# Altium schematic sheet Notch_Filter.SchDoc
size A4; DocumentNumber: 3; SheetNumber: 4; SheetTotal: 4
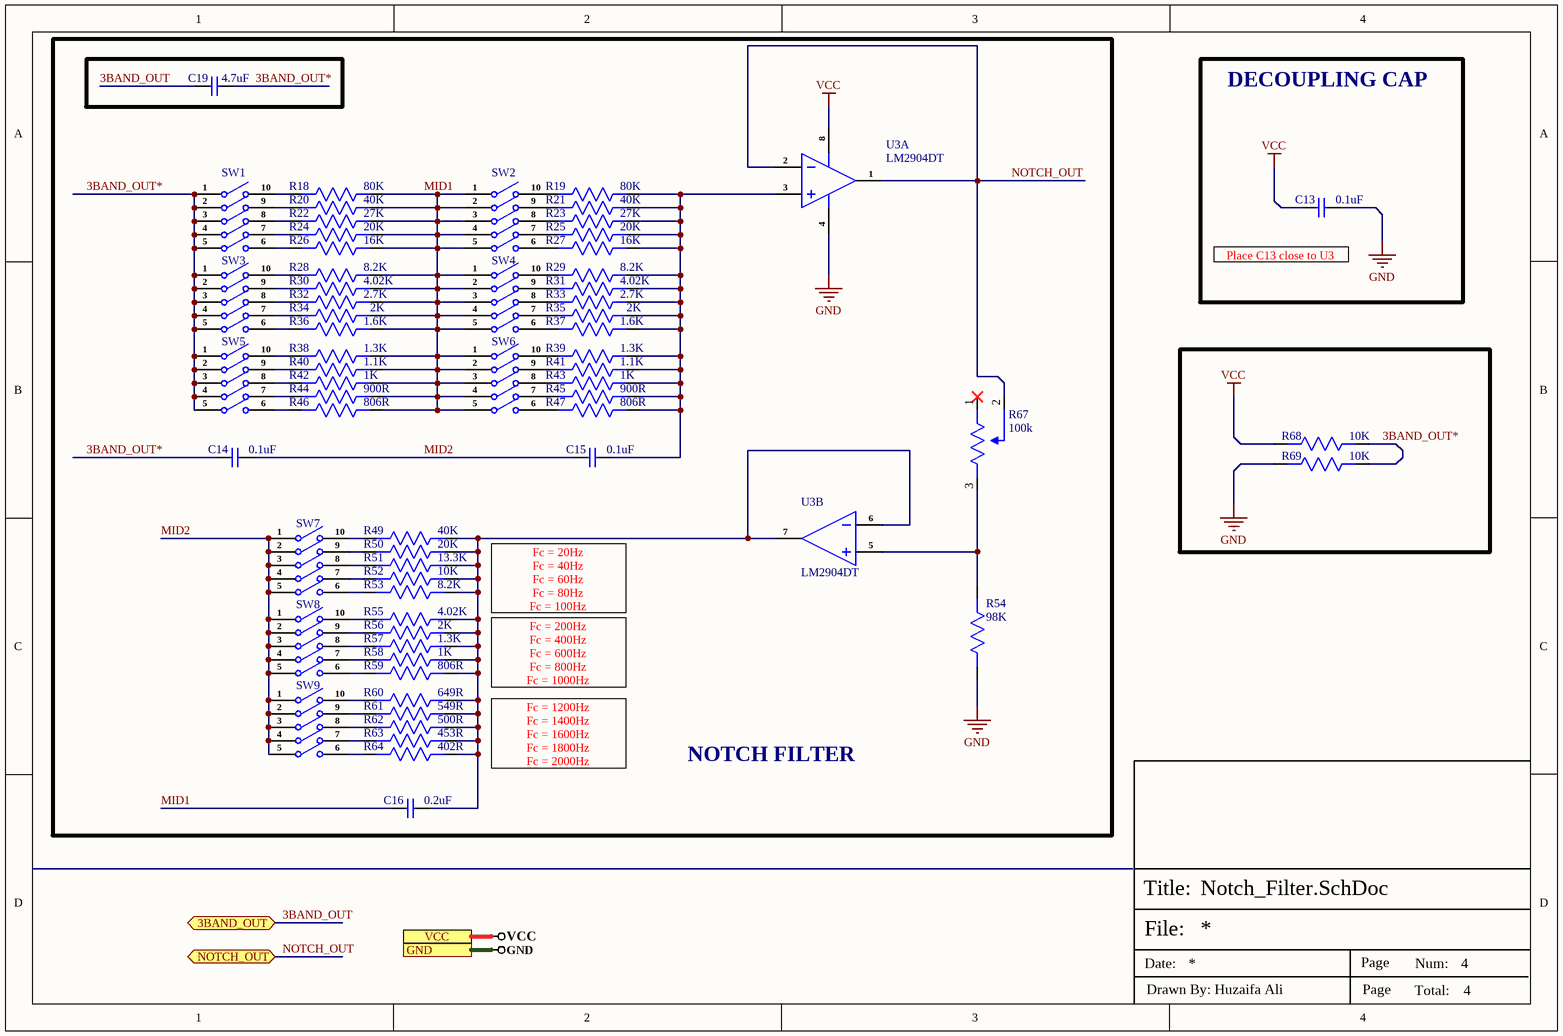
[diagram p0: Notch_Filter.SchDoc]

## Parts
C13  0.1uF  [CAP-0603]
C14  0.1uF  [Cap-1206]
C15  0.1uF  [Cap-1206]
C16  0.2uF  [Cap-0805]
C19  4.7uF  [Cap-1206]
R18  80K  [Res-0603]
R19  80K  [Res-0603]
R20  40K  [RES-0805]
R21  40K  [RES-0805]
R22  27K  [Res-0402]
R23  27K  [Res-0402]
R24  20K  [Res-0603]
R25  20K  [Res-0603]
R26  16K  [Res-0603]
R27  16K  [Res-0603]
R28  8.2K  [Res-0603]
R29  8.2K  [Res-0603]
R30  4.02K  [Res-0402]
R31  4.02K  [Res-0402]
R32  2.7K  [Res-0603]
R33  2.7K  [Res-0603]
R34  2K  [Res-0603]
R35  2K  [Res-0603]
R36  1.6K  [Res-0402]
R37  1.6K  [Res-0402]
R38  1.3K  [Res-0603]
R39  1.3K  [Res-0603]
R40  1.1K  [Res-0603]
R41  1.1K  [Res-0603]
R42  1K  [Res-0603]
R43  1K  [Res-0603]
R44  900R  [RES-0805]
R45  900R  [RES-0805]
R46  806R  [Res-0402]
R47  806R  [Res-0402]
R49  40K  [RES-0805]
R50  20K  [Res-0603]
R51  13.3K  [Res-0603]
R52  10K  [Res-0603]
R53  8.2K  [Res-0603]
R54  98K  [RES-0805]
R55  4.02K  [Res-0402]
R56  2K  [Res-0603]
R57  1.3K  [Res-0603]
R58  1K  [Res-0603]
R59  806R  [Res-0402]
R60  649R  [RES-0805]
R61  549R  [Res-0402]
R62  500R  [RES-0805]
R63  453R  [Res-0402]
R64  402R  [Res-0603]
R67  100k  [TC33X-2-104E_]
R68  10K  [Res-0603]
R69  10K  [Res-0603]
SW1  DSIC05LS-P  [DSIC05LS-P_]  (value not drawn)
SW2  DSIC05LS-P  [DSIC05LS-P_]  (value not drawn)
SW3  DSIC05LS-P  [DSIC05LS-P_]  (value not drawn)
SW4  DSIC05LS-P  [DSIC05LS-P_]  (value not drawn)
SW5  DSIC05LS-P  [DSIC05LS-P_]  (value not drawn)
SW6  DSIC05LS-P  [DSIC05LS-P_]  (value not drawn)
SW7  DSIC05LS-P  [DSIC05LS-P_]  (value not drawn)
SW8  DSIC05LS-P  [DSIC05LS-P_]  (value not drawn)
SW9  DSIC05LS-P  [DSIC05LS-P_]  (value not drawn)
U3  LM2904DT  [SOIC-8]  (parts A,B of 2)

## Blocks framed on the sheet
NOTCH FILTER: C14-C16 C19 R18-R47 R49-R64 R67 SW1-SW9 U3
DECOUPLING CAP: C13

## Ports
3BAND_OUT (bidir), GND, NOTCH_OUT (bidir), VCC

## Nets
GND: C13.2 R54.2 R69.2 U3.4(VCC-) ; port GND
VCC: C13.1 R68.2 U3.8(VCC+) ; port VCC
3BAND_OUT: C19.1 ; port 3BAND_OUT
3BAND_OUT*: C14.1 C19.2 R68.1 R69.1 SW1.1 SW1.2 SW1.3 SW1.4 SW1.5 SW3.1 SW3.2 SW3.3 SW3.4 SW3.5 SW5.1 SW5.2 SW5.3 SW5.4 SW5.5
MID1: C16.1 R18.1 R20.1 R22.1 R24.1 R26.1 R28.1 R30.1 R32.1 R34.1 R36.1 R38.1 R40.1 R42.1 R44.1 R46.1 SW2.1 SW2.2 SW2.3 SW2.4 SW2.5 SW4.1 SW4.2 SW4.3 SW4.4 SW4.5 SW6.1 SW6.2 SW6.3 SW6.4 SW6.5
MID2: C14.2 C15.1 SW7.1 SW7.2 SW7.3 SW7.4 SW7.5 SW8.1 SW8.2 SW8.3 SW8.4 SW8.5 SW9.1 SW9.2 SW9.3 SW9.4 SW9.5
NOTCH_OUT: R67.2(Wiper) U3.1(1OUT) U3.2(IN-) ; port NOTCH_OUT
NetC15_2: C15.2 R19.1 R21.1 R23.1 R25.1 R27.1 R29.1 R31.1 R33.1 R35.1 R37.1 R39.1 R41.1 R43.1 R45.1 R47.1 U3.3(IN+)
NetC16_2: C16.2 R49.1 R50.1 R51.1 R52.1 R53.1 R55.1 R56.1 R57.1 R58.1 R59.1 R60.1 R61.1 R62.1 R63.1 R64.1 U3.6(2IN-) U3.7(2OUT)
NetR18_2: R18.2 SW1.10
NetR19_2: R19.2 SW2.10
NetR20_2: R20.2 SW1.9
NetR21_2: R21.2 SW2.9
NetR22_2: R22.2 SW1.8
NetR23_2: R23.2 SW2.8
NetR24_2: R24.2 SW1.7
NetR25_2: R25.2 SW2.7
NetR26_2: R26.2 SW1.6
NetR27_2: R27.2 SW2.6
NetR28_2: R28.2 SW3.10
NetR29_2: R29.2 SW4.10
NetR30_2: R30.2 SW3.9
NetR31_2: R31.2 SW4.9
NetR32_2: R32.2 SW3.8
NetR33_2: R33.2 SW4.8
NetR34_2: R34.2 SW3.7
NetR35_2: R35.2 SW4.7
NetR36_2: R36.2 SW3.6
NetR37_2: R37.2 SW4.6
NetR38_2: R38.2 SW5.10
NetR39_2: R39.2 SW6.10
NetR40_2: R40.2 SW5.9
NetR41_2: R41.2 SW6.9
NetR42_2: R42.2 SW5.8
NetR43_2: R43.2 SW6.8
NetR44_2: R44.2 SW5.7
NetR45_2: R45.2 SW6.7
NetR46_2: R46.2 SW5.6
NetR47_2: R47.2 SW6.6
NetR49_2: R49.2 SW7.10
NetR50_2: R50.2 SW7.9
NetR51_2: R51.2 SW7.8
NetR52_2: R52.2 SW7.7
NetR53_2: R53.2 SW7.6
NetR54_1: R54.1 R67.3(CW) U3.5(2IN+)
NetR55_2: R55.2 SW8.10
NetR56_2: R56.2 SW8.9
NetR57_2: R57.2 SW8.8
NetR58_2: R58.2 SW8.7
NetR59_2: R59.2 SW8.6
NetR60_2: R60.2 SW9.10
NetR61_2: R61.2 SW9.9
NetR62_2: R62.2 SW9.8
NetR63_2: R63.2 SW9.7
NetR64_2: R64.2 SW9.6

Not connected (* = marked no-connect by the designer): R67 1(CCW)*

## Notes on the sheet
- (near C13) Place C13 close to U3
- Fc = 20Hz
  Fc = 40Hz
  Fc = 60Hz
  Fc = 80Hz
  Fc = 100Hz
- Fc = 200Hz
  Fc = 400Hz
  Fc = 600Hz
  Fc = 800Hz
  Fc = 1000Hz
- Fc = 1200Hz
  Fc = 1400Hz
  Fc = 1600Hz
  Fc = 1800Hz
  Fc = 2000Hz
- File:
- Title:
- Date:
- Page
- Num:
- Total:
- Drawn By: Huzaifa Ali

## Library data of the parts
C13 = CL10B104KB8NNNL: CAP CER 0.1UF 50V X7R 0603; Manufacturer: Samsung; Capacitance: 100nF; Tolerance: 10%; Supplier 1: Digi-Key; Manufacturer Part Number: CL10B104KB8NNNL; Stock 1: 3731229; Pricing 1: 1=0.1, 10=0.03, 50=0.0164, 100=0.0134, 500=0.00958, 1000=0.00753, 2500=0.00684, 5000=0.0063 (USD); Mount: Surface Mount; Case/Package: 0603; Min Operating Temperature: -55°C; Max Operating Temperature: 125°C; Dielectric: X7R; Packaging: Tape and Reel; Package Quantity: 15000; Voltage Rating: 50V; Voltage Rating (DC): 50V; Series: CL; Construction: Flat; Length: 1.6mm; Width: 0.031inch; Height: 0.8mm; Thickness: 0.035inch; Depth: 0.8mm; Radiation Hardening: No; RoHS Compliant: Yes; ComponentLink1URL: https://www.verical.com/server-webapp/html/getDatasheet?partID=357523&src-supplier=Verical; ComponentLink1Description: https://www.verical.com/server-webapp/html/getDatasheet?partID=357523&src-supplier=Verical; ComponentLink2URL: https://media.digikey.com/pdf/Data%20Sheets/Samsung%20PDFs/CL_Series_MLCC_ds.pdf?src-supplier=Digi-Key; ComponentLink2Description: https://media.digikey.com/pdf/Data%20Sheets/Samsung%20PDFs/CL_Series_MLCC_ds.pdf?src-supplier=Digi-Key; Supplier Part Number 1: 1276-CL10B104KB8NNNLCT-ND; LCSC Part Number: C913912
C14 C15 = GRM31C5C1H104FA01L: 50V 100nF C0G ±1% 1206 Multilayer Ceramic Capacitors MLCC - SMD/SMT ROHS; Manufacturer: Murata Electronics; LCSC Part Number: C2981728; Item Type: Capacitor; Manufacturer Part Number: GRM31C5C1H104FA01L; ComponentLink1Description: LCSC; ComponentLink1URL: https://www.lcsc.com/product-detail/Multilayer-Ceramic-Capacitors-MLCC-SMD-SMT_Murata-Electronics-GRM31C5C1H104FA01L_C2981728.html
C16 = NL0805B204K500CPBN: 50V 200nF ±10% 0805 Multilayer Ceramic Capacitors MLCC - SMD/SMT ROHS; Manufacturer: HUI JU; Manufacturer Part Number: NL0805B204K500CPBN; LCSC Part Number: C918135; Item Type: Capacitor; ComponentLink1Description: LCSC; ComponentLink1URL: https://www.lcsc.com/product-detail/Multilayer-Ceramic-Capacitors-MLCC-SMD-SMT_HUI-JU-NL0805B204K500CPBN_C918135.html; Value: 0.2uF
C19 = C3216X7R1H475K160AC: CAP CER 4.7UF 50V X7R 1206; Manufacturer: TDK; Dielectric Material: Ceramic; Tolerance: 10%; Supplier 1: Digi-Key; Manufacturer Part Number: C3216X7R1H475K160AC; Stock 1: 93848; Pricing 1: 1=0.76, 10=0.535, 50=0.4042, 100=0.3521, 500=0.26082, 1000=0.2217 (USD); Mount: Surface Mount; Case/Package: 1206; Case Code (Metric): 3216; Case Code (Imperial): 1206; Weight: 0.000571oz; Min Operating Temperature: -55°C; Max Operating Temperature: 125°C; Capacitance: 4.7uF; Voltage Rating: 50V; Packaging: Tape and Reel; Voltage Rating (DC): 50V; Termination: SMD/SMT; Series: C; Package Quantity: 1; Dielectric: X7R; Resistor Type: Ceramic; Length: 3.2mm; Width: 0.063inch; Depth: 1.6mm; Thickness: 1.6mm; REACH SVHC: No SVHC; Lead Free: Lead Free; RoHS Compliant: Yes; ComponentLink1URL: https://product.tdk.com/info/en/catalog/datasheets/mlcc_commercial_general_en.pdf?src-supplier=Digi-Key; ComponentLink1Description: https://product.tdk.com/info/en/catalog/datasheets/mlcc_commercial_general_en.pdf?src-supplier=Digi-Key; ComponentLink2URL: http://www.mouser.com/ds/2/400/lcc_commercial_general_en-560200.pdf?src-supplier=Mouser; ComponentLink2Description: http://www.mouser.com/ds/2/400/lcc_commercial_general_en-560200.pdf?src-supplier=Mouser; ComponentLink3URL: http://product.tdk.com/capacitor/mlcc/en/documents/mlcc_commercial_general_en.pdf?src-supplier=Future+Electronics; ComponentLink3Description: http://product.tdk.com/capacitor/mlcc/en/documents/mlcc_commercial_general_en.pdf?src-supplier=Future+Electronics; Supplier Part Number 1: 445-8032-1-ND; LCSC Part Number: C2167787
R18 R19 = ARG03FTC8002N: ±1% 80kΩ 0603 Chip Resistor - Surface Mount ROHS; Manufacturer: Viking Tech; Manufacturer Part Number: ARG03FTC8002N; LCSC Part Number: C3014409; Item Type: Resistor; Value: 80K; ComponentLink1Description: LCSC; ComponentLink1URL: https://www.lcsc.com/product-detail/Chip-Resistor-Surface-Mount_Viking-Tech-ARG03FTC8002N_C3014409.html
R20 R21 R49 = AR05BTC4002: ±0.1% 40kΩ 0805 Chip Resistor - Surface Mount ROHS; Manufacturer: Viking Tech; Manufacturer Part Number: AR05BTC4002; LCSC Part Number: C5266069; Item Type: Resistor; ComponentLink1Description: LCSC; ComponentLink1URL: https://www.lcsc.com/product-detail/Chip-Resistor-Surface-Mount_Viking-Tech-AR05BTC4002_C5266069.html; Value: 40K
R22 R23 = ARG02BTC2702: ±25ppm/℃ ±0.1% 27kΩ 0402 Chip Resistor - Surface Mount ROHS; Manufacturer: Viking Tech; Manufacturer Part Number: ARG02BTC2702; LCSC Part Number: C5266105; Item Type: Resistor; ComponentLink1Description: LCSC; ComponentLink1URL: https://www.lcsc.com/product-detail/Chip-Resistor-Surface-Mount_Viking-Tech-ARG02BTC2702_C5266105.html; Value: 27K
R24 R25 R50 = AR03BTCX2002: 100mW ±25ppm/℃ ±0.1% 20kΩ 0603 Chip Resistor - Surface Mount ROHS; Manufacturer: Viking Tech; Manufacturer Part Number: AR03BTCX2002; LCSC Part Number: C319766; Item Type: Resistor; ComponentLink1Description: LCSC; ComponentLink1URL: https://www.lcsc.com/product-detail/Chip-Resistor-Surface-Mount_Viking-Tech-AR03BTCX2002_C319766.html; Value: 20K
R26 R27 = RC0603DR-0716KL: RES 16K OHM 0.5% 1/10W 0603; Manufacturer: Yageo; Resistance: 16kR; Max Power Dissipation: 100mW; Temperature Coefficient: 100ppm/°C; Item Type: Resistor; Supplier 1: Avnet; Manufacturer Part Number: RC0603DR-0716KL; RoHS: Yes; Category: Chip SMD Resistors; Pricing 1: 5000=0.00430, 10000=0.00424, 20000=0.00411 (USD); Case/Package: 0603; Min Operating Temperature: -55°C; Max Operating Temperature: 155°C; Tolerance: 0.5%; Packaging: Tape and Reel; Resistor Type: Thick Film; Number of Terminations: 2; Features: Moisture Resistant; Length: 0.063inch; Width: 0.031inch; Height: 0.022inch; RoHS Compliant: Yes; ComponentLink1URL: http://www.yageo.com.tw/exep/pages/download/literatures/PYu-R_INT-thick_7.pdf?src-supplier=Digi-Key; ComponentLink1Description: http://www.yageo.com.tw/exep/pages/download/literatures/PYu-R_INT-thick_7.pdf?src-supplier=Digi-Key; Supplier Part Number 1: RC0603DR-0716KL; LCSC Part Number: C327136
R28 R29 R53 = RT0603BRD078K2L: RES SMD 8.2K OHM 0.1% 1/10W 0603; Manufacturer: Yageo; Power: 100mW; Rated Temperature: 70°C; Value: 8.2kR; Temperature Coefficient: 25ppm/°C; Working Voltage: 75V; Package Height: 0.45mm; Package Length: 1.6mm; Package Width: 0.8mm; Item Type: Resistor; Supplier 1: Rs; Manufacturer Part Number: RT0603BRD078K2L; RoHS: Yes; Category: Chip SMD Resistors; Stock 1: 4900; Pricing 1: 100=0.21900, 250=0.20400, 500=0.19000, 1000=0.17400 (GBP); Mounting Technology: Surface Mount; Pins: 2; Case/Package: 0603; Min Operating Temperature: -55°C; Max Operating Temperature: 155°C; Tolerance: 0.1%; Resistor Type: FIXED RESISTOR; Construction: Chip; Package Style: SMTMeter; Packaging: Tape and Reel; Technology: THIN FILM; Termination: Wraparound; Reach SVHC Compliant: Yes; RoHS Compliant: Yes; ComponentLink1URL: https://datasheet.ciiva.com:443/pdfs/VipMasterIC/IC/YAGO/YAGO-S-A0008510989/YAGO-S-A0008510989-1.pdf?src-supplier=IHS+Markit; ComponentLink1Description: https://datasheet.ciiva.com:443/pdfs/VipMasterIC/IC/YAGO/YAGO-S-A0008510989/YAGO-S-A0008510989-1.pdf?src-supplier=IHS+Markit; ComponentLink2URL: https://datasheet.ciiva.com/12809/pyu-rt-1-to-0-05-rohs-l-4-12809820.pdf?src-supplier=Mouser; ComponentLink2Description: https://datasheet.ciiva.com/12809/pyu-rt-1-to-0-05-rohs-l-4-12809820.pdf?src-supplier=Mouser; Supplier Part Number 1: 1991627P; LCSC Part Number: C861589
R30 R31 R55 = RC0402FR-074K02L: RES 4.02K OHM 1% 1/16W 0402; Manufacturer: Yageo; Resistance: 4.02kR; Temperature Coefficient: 100ppm/°C; Power Rating: 62.5mW; Voltage Rating: 50V; Max Power Dissipation: 63mW; Supplier 1: Mouser; Manufacturer Part Number: RC0402FR-074K02L; RoHS: Yes; Category: Chip SMD Resistors; Stock 1: 302754; Pricing 1: 1=0.10000, 10=0.01200, 50=0.01200, 100=0.00500, 1000=0.00300, 2500=0.00200, 10000=0.00100 (USD); Case/Package: 0402; Contact Plating: Tin,Matte; Case Code (Metric): 1005; Case Code (Imperial): 0402; Min Operating Temperature: -55°C; Max Operating Temperature: 155°C; Tolerance: 1%; Resistor Type: Thick Film; Packaging: Tape and Reel; Package Quantity: 1; Number of Terminations: 2; Termination: SMD/SMT; Working Voltage: 50V; Features: Moisture Resistant; Series: RC; Construction: Rectangular; Technology: THICK FILM; Length: 1mm; Width: 0.02inch; Height: 0.016inch; Depth: 0.5mm; Military Standard: Not; Lead Free: Lead Free; RoHS Compliant: Yes; ComponentLink1URL: https://datasheet.ciiva.com/2553/pyu-r-int-thick-7-2553258.pdf?src-supplier=Digi-Key; ComponentLink1Description: https://datasheet.ciiva.com/2553/pyu-r-int-thick-7-2553258.pdf?src-supplier=Digi-Key; ComponentLink2URL: https://datasheet.ciiva.com/2553/pyu-r-int-thick-7-2553259.pdf?src-supplier=Digi-Key; ComponentLink2Description: https://datasheet.ciiva.com/2553/pyu-r-int-thick-7-2553259.pdf?src-supplier=Digi-Key; ComponentLink3URL: https://datasheet.ciiva.com/2553/pyu-r-int-thick-7-2553257.pdf?src-supplier=Digi-Key; ComponentLink3Description: https://datasheet.ciiva.com/2553/pyu-r-int-thick-7-2553257.pdf?src-supplier=Digi-Key; ComponentLink4URL: https://datasheet.ciiva.com/12668/pyu-rc0402-51-rohs-l-6-r-12668204.pdf?src-supplier=Mouser; ComponentLink4Description: https://datasheet.ciiva.com/12668/pyu-rc0402-51-rohs-l-6-r-12668204.pdf?src-supplier=Mouser; ComponentLink5URL: https://datasheet.ciiva.com/16741/pyu-rc0402-51-rohs-l-6-r-16741438.pdf?src-supplier=Future+Electronics; ComponentLink5Description: https://datasheet.ciiva.com/16741/pyu-rc0402-51-rohs-l-6-r-16741438.pdf?src-supplier=Future+Electronics; Supplier Part Number 1: 603-RC0402FR-074K02L; LCSC Part Number: C137968
R32 R33 = RC0603FR-072K7L: RES 2.7K OHM 1% 1/10W 0603; Manufacturer: Yageo; Resistance: 2.7kR; Voltage Rating (DC): 50V; Temperature Coefficient: 100ppm/°C; Power Rating: 100mW; Item Type: Resistor; Supplier 1: Avnet; Manufacturer Part Number: RC0603FR-072K7L; RoHS: Yes; Category: Chip SMD Resistors; Stock 1: 5000; Pricing 1: 5000=0.00133, 10000=0.00131, 20000=0.00127 (USD); Case/Package: 0603; Number of Pins: 2; Case Code (Imperial): 0603; Case Code (Metric): 1608; Size Code: 0603; Min Operating Temperature: -55°C; Max Operating Temperature: 155°C; Tolerance: 1%; Packaging: Tape and Reel; Resistor Type: Thick Film; Voltage Rating: 50V; Package Quantity: 1; Termination: SMD/SMT; Number of Terminations: 2; Max Power Dissipation: 100mW; Features: Moisture Resistant; Series: RC; Resistance Tolerance: 1%; Construction: Rectangular; Length: 0.063inch; Width: 0.031inch; Height: 0.022inch; Depth: 0.8mm; Reach SVHC Compliant: Yes; Lead Free: Lead Free; Military Standard: Not; RoHS Compliant: Yes; Supplier Part Number 1: RC0603FR-072K7L; LCSC Part Number: C114612
R34 R35 R56 = AR03BTCX2001: 100mW ±25ppm/℃ ±0.1% 2kΩ 0603 Chip Resistor - Surface Mount ROHS; Manufacturer: Viking Tech; Manufacturer Part Number: AR03BTCX2001; LCSC Part Number: C318130; Item Type: Resistor; ComponentLink1Description: LCSC; ComponentLink1URL: https://www.lcsc.com/product-detail/Chip-Resistor-Surface-Mount_Viking-Tech-AR03BTCX2001_C318130.html; Value: 2K
R36 R37 = RT0402BRD071K6L: RES SMD 1.6K OHM 0.1% 1/16W 0402; Manufacturer: Yageo; Resistance: 1.6kR; Power Rating: 62.5mW; Voltage Rating: 50V; Temperature Coefficient: 25ppm/°C; Max Power Dissipation: 63mW; Item Type: Resistor; Supplier 1: Digi-Key; Manufacturer Part Number: RT0402BRD071K6L; RoHS: Yes; Category: Chip SMD Resistors; Stock 1: 20555; Pricing 1: 1=0.40000, 10=0.33600, 100=0.13130, 500=0.07938, 1000=0.05496, 2500=0.05038, 5000=0.04580 (USD); Case/Package: 0402; Case Code (Imperial): 0402; Case Code (Metric): 1005; Weight: 2.3E-05oz; Min Operating Temperature: -55°C; Max Operating Temperature: 125°C; Packaging: Tape and Reel; Tolerance: 0.1%; Package Quantity: 10000; Resistor Type: Thin Film; Termination: SMD/SMT; Number of Terminations: 2; Voltage Rating (DC): 50V; Series: RT; Length: 0.039inch; Width: 0.5mm; Height: 0.014inch; Lead Free: Lead Free; RoHS Compliant: Yes; ComponentLink1URL: https://datasheet.ciiva.com/2582/pyu-rt-1-to-0-05-rohs-l-5-2582211.pdf?src-supplier=Digi-Key; ComponentLink1Description: https://datasheet.ciiva.com/2582/pyu-rt-1-to-0-05-rohs-l-5-2582211.pdf?src-supplier=Digi-Key; LCSC Part Number: C852616; Supplier Part Number 1: YAG4199CT-ND
R38 R39 R57 = AR03BTCX1301: 100mW ±25ppm/℃ ±0.1% 1.3kΩ 0603 Chip Resistor - Surface Mount ROHS; Manufacturer: Viking Tech; Manufacturer Part Number: AR03BTCX1301; LCSC Part Number: C2984321; Item Type: Resistor; ComponentLink1Description: LCSC; ComponentLink1URL: https://www.lcsc.com/product-detail/Chip-Resistor-Surface-Mount_Viking-Tech-AR03BTCX1301_C2984321.html; Value: 1.3K
R40 R41 = RT0603BRD071K1L: RES SMD 1.1K OHM 0.1% 1/10W 0603; Manufacturer: Yageo; Resistance: 1.1kR; Temperature Coefficient: 25ppm/°C; Power Rating: 100mW; Voltage Rating: 75V; Voltage Rating (DC): 50V; Item Type: Resistor; Supplier 1: Rs; Manufacturer Part Number: RT0603BRD071K1L; RoHS: Yes; Category: Chip SMD Resistors; Stock 1: 7030; Pricing 1: 10=0.23500, 100=0.21900, 250=0.20400, 500=0.19000, 1000=0.17400 (GBP); Case/Package: 0603; Contact Plating: Tin,Matte; Case Code (Metric): 1608; Case Code (Imperial): 0603; Min Operating Temperature: -55°C; Max Operating Temperature: 125°C; Tolerance: 0.1%; Resistor Type: Thin Film; Package Quantity: 5000; Packaging: Tape and Reel; Number of Terminations: 2; Termination: SMD/SMT; Max Power Dissipation: 100mW; Features: Moisture Resistant; Series: RT; Length: 0.063inch; Width: 0.031inch; Height: 0.022inch; Radiation Hardening: No; Lead Free: Lead Free; RoHS Compliant: Yes; ComponentLink1URL: https://datasheet.ciiva.com/12725/pyu-rt-1-to-0-05-rohs-l-4-12725819.pdf?src-supplier=Mouser; ComponentLink1Description: https://datasheet.ciiva.com/12725/pyu-rt-1-to-0-05-rohs-l-4-12725819.pdf?src-supplier=Mouser; ComponentLink2URL: https://datasheet.ciiva.com/2585/pyu-rt-1-to-0-05-rohs-l-4-2585740.pdf?src-supplier=Digi-Key; ComponentLink2Description: https://datasheet.ciiva.com/2585/pyu-rt-1-to-0-05-rohs-l-4-2585740.pdf?src-supplier=Digi-Key; ComponentLink3URL: https://datasheet.ciiva.com/8895/pyu-rt-1-to-0-05-rohs-l-4-8895949.pdf?src-supplier=Avnet; ComponentLink3Description: https://datasheet.ciiva.com/8895/pyu-rt-1-to-0-05-rohs-l-4-8895949.pdf?src-supplier=Avnet; LCSC Part Number: C705736; Supplier Part Number 1: 1991436
R42 R43 R58 = RT0603BRD071KL: RES SMD 1K OHM 0.1% 1/10W 0603; Manufacturer: Yageo; Resistance: 1kR; Power Rating: 100mW; Voltage Rating: 75V; Temperature Coefficient: 25ppm/°C; Voltage Rating (DC): 50V; Item Type: Resistor; Supplier 1: Arrow Electronics; Manufacturer Part Number: RT0603BRD071KL; RoHS: Yes; Category: Chip SMD Resistors; Stock 1: 130000; Pricing 1: 5000=0.03900, 10000=0.03450, 25000=0.03070, 50000=0.02040 (USD); Mount: Surface Mount; Case/Package: 0603; Case Code (Metric): 1608; Case Code (Imperial): 0603; Contact Plating: Tin,Lead; Size Code: 0603; Min Operating Temperature: -55°C; Max Operating Temperature: 125°C; Package Quantity: 5000; Packaging: Tape and Reel; Resistor Type: Thin Film; Number of Terminations: 2; Termination: SMD/SMT; Max Power Dissipation: 100mW; Features: Moisture Resistant; Series: RT; Technology: THIN FILM; Construction: Rectangular; Length: 1.6mm; Width: 0.031inch; Height: 0.022inch; Depth: 0.8mm; Military Standard: Not; Lead Free: Lead Free; RoHS Compliant: Yes; ComponentLink1URL: https://datasheet.ciiva.com/11819/0900766b8079c86e-11819652.pdf?src-supplier=RSComponents; ComponentLink1Description: https://datasheet.ciiva.com/11819/0900766b8079c86e-11819652.pdf?src-supplier=RSComponents; ComponentLink2URL: https://datasheet.ciiva.com/5624/pyu-rt-1-to-0-05-rohs-l-4-5624759.pdf?src-supplier=Mouser; ComponentLink2Description: https://datasheet.ciiva.com/5624/pyu-rt-1-to-0-05-rohs-l-4-5624759.pdf?src-supplier=Mouser; ComponentLink3URL: https://datasheet.ciiva.com/29718/pyu-rt-1-to-0-05-rohs-l-4-29718010.pdf?src-supplier=Digi-Key; ComponentLink3Description: https://datasheet.ciiva.com/29718/pyu-rt-1-to-0-05-rohs-l-4-29718010.pdf?src-supplier=Digi-Key; ComponentLink4URL: https://datasheet.ciiva.com/29718/pyu-rt-1-to-0-05-rohs-l-4-29718011.pdf?src-supplier=Digi-Key; ComponentLink4Description: https://datasheet.ciiva.com/29718/pyu-rt-1-to-0-05-rohs-l-4-29718011.pdf?src-supplier=Digi-Key; Supplier Part Number 1: RT0603BRD071KL; LCSC Part Number: C110776
R44 R45 = ARG05BTC9000N: 125mW Thin Film Resistor 150V ±25ppm/℃ ±0.1% -55℃~+155℃ 900Ω 0805 Chip Resistor - Surface Mount ROHS; Manufacturer: Viking Tech; Manufacturer Part Number: ARG05BTC9000N; LCSC Part Number: C2828704; Item Type: Resistor; ComponentLink1Description: LCSC; ComponentLink1URL: https://www.lcsc.com/product-detail/Chip-Resistor-Surface-Mount_Viking-Tech-ARG05BTC9000N_C2828704.html; Value: 900R
R46 R47 R59 = RT0402BRD07806RL: RES SMD 806 OHM 0.1% 1/16W 0402; Manufacturer: Yageo; Voltage Rating: 50V; Power Rating: 62.5mW; Temperature Coefficient: 25ppm/°C; Max Power Dissipation: 63mW; Item Type: Resistor; Supplier 1: Arrow Electronics; Manufacturer Part Number: RT0402BRD07806RL; RoHS: Yes; Category: Chip SMD Resistors; Stock 1: 104; Pricing 1: 1=0.32050, 10=0.28580, 25=0.25690, 100=0.10950 (USD); Case/Package: 0402; Case Code (Metric): 1005; Case Code (Imperial): 0402; Min Operating Temperature: -55°C; Max Operating Temperature: 155°C; Resistance: 806R; Tolerance: 0.1%; Packaging: Tape and Reel; Package Quantity: 10000; Resistor Type: Thin Film; Termination: SMD/SMT; Number of Terminations: 2; Voltage Rating (DC): 50V; Features: Moisture Resistant; Series: RT; Length: 0.039inch; Width: 0.02inch; Height: 0.014inch; Lead Free: Lead Free; RoHS Compliant: Yes; ComponentLink1URL: https://datasheet.ciiva.com/2582/pyu-rt-1-to-0-05-rohs-l-4-2582500.pdf?src-supplier=Digi-Key; ComponentLink1Description: https://datasheet.ciiva.com/2582/pyu-rt-1-to-0-05-rohs-l-4-2582500.pdf?src-supplier=Digi-Key; ComponentLink2URL: https://datasheet.ciiva.com/46635/pyu-rt-1-to-0-05-rohs-l-5-46635068.pdf?src-supplier=Digi-Key; ComponentLink2Description: https://datasheet.ciiva.com/46635/pyu-rt-1-to-0-05-rohs-l-5-46635068.pdf?src-supplier=Digi-Key; LCSC Part Number: C852922; Supplier Part Number 1: RT0402BRD07806RL
R51 = RT0603BRD0713K3L: RES SMD 13.3KOHM 0.1% 1/10W 0603; Manufacturer: Yageo; Resistance: 13.3kR; Power Rating: 100mW; Voltage Rating: 75V; Temperature Coefficient: 25ppm/°C; Voltage Rating (DC): 50V; Item Type: Resistor; Supplier 1: Arrow Electronics; Manufacturer Part Number: RT0603BRD0713K3L; RoHS: Yes; Category: Chip SMD Resistors; Stock 1: 4750; Pricing 1: 1=0.29220, 10=0.24060, 25=0.23820, 100=0.10400, 250=0.10250, 500=0.10060, 1000=0.06040, 3000=0.04000 (USD); Case/Package: 0603; Case Code (Metric): 1608; Case Code (Imperial): 0603; Contact Plating: Tin,Matte; Min Operating Temperature: -55°C; Max Operating Temperature: 125°C; Tolerance: 0.1%; Packaging: Tape and Reel; Package Quantity: 5000; Resistor Type: Thin Film; Termination: SMD/SMT; Number of Terminations: 2; Max Power Dissipation: 100mW; Features: Moisture Resistant; Series: RT; Construction: Rectangular; Length: 0.063inch; Width: 0.031inch; Height: 0.022inch; Depth: 0.8mm; Radiation Hardening: No; Military Standard: Not; Lead Free: Lead Free; RoHS Compliant: Yes; ComponentLink1URL: https://datasheet.ciiva.com/12725/pyu-rt-1-to-0-05-rohs-l-4-12725067.pdf?src-supplier=Mouser; ComponentLink1Description: https://datasheet.ciiva.com/12725/pyu-rt-1-to-0-05-rohs-l-4-12725067.pdf?src-supplier=Mouser; ComponentLink2URL: https://datasheet.ciiva.com/8890/pyu-rt-1-to-0-05-rohs-l-4-8890934.pdf?src-supplier=Avnet; ComponentLink2Description: https://datasheet.ciiva.com/8890/pyu-rt-1-to-0-05-rohs-l-4-8890934.pdf?src-supplier=Avnet; ComponentLink3URL: https://datasheet.ciiva.com/2585/pyu-rt-1-to-0-05-rohs-l-4-2585661.pdf?src-supplier=Digi-Key; ComponentLink3Description: https://datasheet.ciiva.com/2585/pyu-rt-1-to-0-05-rohs-l-4-2585661.pdf?src-supplier=Digi-Key; ComponentLink4URL: https://datasheet.ciiva.com/46635/pyu-rt-1-to-0-05-rohs-l-5-46635007.pdf?src-supplier=Digi-Key; ComponentLink4Description: https://datasheet.ciiva.com/46635/pyu-rt-1-to-0-05-rohs-l-5-46635007.pdf?src-supplier=Digi-Key; LCSC Part Number: C861117; Supplier Part Number 1: RT0603BRD0713K3L; Value: 13.3K
R52 R68 R69 = RT0603BRD0710KL: RES SMD 10K OHM 0.1% 1/10W 0603; Manufacturer: Yageo; Power: 100mW; Rated Temperature: 70°C; Value: 10kR; Temperature Coefficient: 25ppm/°C; Working Voltage: 75V; Package Height: 0.45mm; Package Length: 1.6mm; Package Width: 0.8mm; Item Type: Resistor; Supplier 1: Rs; Manufacturer Part Number: RT0603BRD0710KL; RoHS: Yes; Category: Chip SMD Resistors; Stock 1: 20510; Pricing 1: 100=0.29800, 250=0.27800, 500=0.25900, 1000=0.23700 (GBP); Mounting Technology: Surface Mount; Pins: 2; Case/Package: 0603; Min Operating Temperature: -55°C; Max Operating Temperature: 155°C; Tolerance: 0.1%; Resistor Type: FIXED RESISTOR; Construction: Chip; Package Style: SMTMeter; Packaging: Tape and Reel; Technology: THIN FILM; Termination: Wraparound; Reach SVHC Compliant: Yes; RoHS Compliant: Yes; ComponentLink1URL: https://datasheet.ciiva.com:443/pdfs/VipMasterIC/IC/YAGO/YAGO-S-A0008510989/YAGO-S-A0008510989-1.pdf?src-supplier=IHS+Markit; ComponentLink1Description: https://datasheet.ciiva.com:443/pdfs/VipMasterIC/IC/YAGO/YAGO-S-A0008510989/YAGO-S-A0008510989-1.pdf?src-supplier=IHS+Markit; ComponentLink2URL: https://datasheet.ciiva.com/5624/pyu-rt-1-to-0-05-rohs-l-4-5624351.pdf?src-supplier=Mouser; ComponentLink2Description: https://datasheet.ciiva.com/5624/pyu-rt-1-to-0-05-rohs-l-4-5624351.pdf?src-supplier=Mouser; ComponentLink3URL: https://datasheet.ciiva.com/29721/pyu-rt-1-to-0-05-rohs-l-4-29721177.pdf?src-supplier=Digi-Key; ComponentLink3Description: https://datasheet.ciiva.com/29721/pyu-rt-1-to-0-05-rohs-l-4-29721177.pdf?src-supplier=Digi-Key; Supplier Part Number 1: 1991391P; LCSC Part Number: C95204
R54 = FRC0805F9802TS: 125mW Thick Film Resistors 150V ±100ppm/℃ ±1% -55℃~+155℃ 98kΩ 0805 Chip Resistor - Surface Mount ROHS; Manufacturer: FOJAN; Manufacturer Part Number: FRC0805F9802TS; LCSC Part Number: C2933514; Item type: Resistor; ComponentLink1Description: LCSC; ComponentLink1URL: https://www.lcsc.com/product-detail/Chip-Resistor-Surface-Mount_FOJAN-FRC0805F9802TS_C2933514.html; Value: 98K
R60 = RT0805BRD07649RL: RES SMD 649 OHM 0.1% 1/8W 0805; Manufacturer: Yageo; Power Rating: 125mW; Voltage Rating: 150V; Temperature Coefficient: 25ppm/°C; Item Type: Resistor; Supplier 1: Digi-Key; Manufacturer Part Number: RT0805BRD07649RL; RoHS: Yes; Category: Chip SMD Resistors; Stock 1: 6872; Pricing 1: 1=0.38000, 10=0.27200, 100=0.10870, 500=0.07404, 1000=0.05357, 2500=0.04963 (USD); Case/Package: 0805; Case Code (Metric): 2012; Case Code (Imperial): 0805; Contact Plating: Tin,Matte; Min Operating Temperature: -55°C; Max Operating Temperature: 125°C; Resistance: 649R; Tolerance: 0.1%; Package Quantity: 5000; Packaging: Tape and Reel; Resistor Type: Thin Film; Number of Terminations: 2; Termination: SMD/SMT; Max Power Dissipation: 125mW; Voltage Rating (DC): 150V; Series: RT; Length: 0.079inch; Width: 0.049inch; Height: 0.024inch; Radiation Hardening: No; Lead Free: Lead Free; RoHS Compliant: Yes; ComponentLink1URL: https://datasheet.ciiva.com/2585/pyu-rt-1-to-0-05-rohs-l-5-2585132.pdf?src-supplier=Digi-Key; ComponentLink1Description: https://datasheet.ciiva.com/2585/pyu-rt-1-to-0-05-rohs-l-5-2585132.pdf?src-supplier=Digi-Key; ComponentLink2URL: https://datasheet.ciiva.com/12704/pyu-rt-1-to-0-05-rohs-l-4-12704493.pdf?src-supplier=Mouser; ComponentLink2Description: https://datasheet.ciiva.com/12704/pyu-rt-1-to-0-05-rohs-l-4-12704493.pdf?src-supplier=Mouser; Supplier Part Number 1: YAG4930CT-ND; LCSC Part Number: C865602
R61 = ARG02BTC5490: 62.5mW Thin Film Resistor 50V ±25ppm/℃ ±0.1% -55℃~+155℃ 549Ω 0402 Chip Resistor - Surface Mount ROHS; Manufacturer: Viking Tech; Manufacturer Part Number: ARG02BTC5490; LCSC Part Number: C2684524; Item Type: Resistor; ComponentLink1Description: LCSC; ComponentLink1URL: https://www.lcsc.com/product-detail/Chip-Resistor-Surface-Mount_Viking-Tech-ARG02BTC5490_C2684524.html; Value: 549R
R62 = ARG05BTC5000: 125mW Thin Film Resistor 150V ±25ppm/℃ ±0.1% -55℃~+155℃ 500Ω 0805 Chip Resistor - Surface Mount ROHS; Manufacturer: Viking Tech; Manufacturer Part Number: ARG05BTC5000; LCSC Part Number: C2828711; Item Type: Resistor; ComponentLink1Description: LCSC; ComponentLink1URL: https://www.lcsc.com/product-detail/Chip-Resistor-Surface-Mount_Viking-Tech-ARG05BTC5000_C2828711.html; Value: 500R
R63 = RT0402BRD07453RL: RES SMD 453 OHM 0.1% 1/16W 0402; Manufacturer: Yageo; Voltage Rating: 50V; Power Rating: 62.5mW; Temperature Coefficient: 25ppm/°C; Item Type: Resistor; Supplier 1: Digi-Key; Manufacturer Part Number: RT0402BRD07453RL; RoHS: Yes; Category: Chip SMD Resistors; Stock 1: 59576; Pricing 1: 1=0.40000, 10=0.33600, 100=0.13130, 500=0.07938, 1000=0.05496, 2500=0.05038, 5000=0.04580 (USD); Case/Package: 0402; Case Code (Metric): 1005; Case Code (Imperial): 0402; Min Operating Temperature: -55°C; Max Operating Temperature: 125°C; Resistance: 453R; Tolerance: 0.1%; Packaging: Tape and Reel; Termination: SMD/SMT; Voltage Rating (DC): 50V; Series: RT; Length: 1mm; Width: 500um; Height: 350um; Lead Free: Lead Free; RoHS Compliant: Yes; ComponentLink1URL: http://www.mouser.com/ds/2/447/yageodocoutput-1125656.pdf?src-supplier=Mouser; ComponentLink1Description: http://www.mouser.com/ds/2/447/yageodocoutput-1125656.pdf?src-supplier=Mouser; ComponentLink2URL: http://www.yageo.com/documents/recent/PYu-RT_1-to-0.01_RoHS_L_9.pdf?src-supplier=Digi-Key; ComponentLink2Description: http://www.yageo.com/documents/recent/PYu-RT_1-to-0.01_RoHS_L_9.pdf?src-supplier=Digi-Key; Supplier Part Number 1: YAG4266CT-ND; LCSC Part Number: C852794
R64 = ARG03BTC4020: 100mW Thin Film Resistor 75V ±25ppm/℃ ±0.1% -55℃~+155℃ 402Ω 0603 Chip Resistor - Surface Mount ROHS; Manufacturer: Viking Tech; Manufacturer Part Number: ARG03BTC4020; LCSC Part Number: C2683044; Item Type: Resistor; ComponentLink1Description: LCSC; ComponentLink1URL: https://www.lcsc.com/product-detail/Chip-Resistor-Surface-Mount_Viking-Tech-ARG03BTC4020_C2683044.html; Value: 402R
R67 = TC33X-2-104E: TRIMMER 100K OHM 0.1W J LEAD TOP; Manufacturer: Bourns; Resistance: 100kR; Tolerance: 25%; Power Rating: 100mW; Number of Turns: 1; Temperature Coefficient: 250ppm/°C; Voltage Rating (DC): 50V; Supplier 1: Arrow Electronics; Manufacturer Part Number: TC33X-2-104E; RoHS: Yes; Category: Variable Resistors and Potentiometers; Stock 1: 12500; Pricing 1: 2500=0.15500, 5000=0.13130 (USD); Mount: Surface Mount; Color: Silver; Weight: 29.4mg; Min Operating Temperature: -40°C; Max Operating Temperature: 100°C; Packaging: Tape and Reel; Package Quantity: 2500; Resistor Type: Carbon,Cermet; Termination: Foot Print; Max Power Dissipation: 100mW; Series: TC33; Resistance Tolerance: 25%; Length: 3mm; Width: 0.118inch; Height: 0.047inch; Depth: 3.8mm; Radiation Hardening: No; REACH SVHC: No SVHC; Military Standard: Not; RoHS Compliant: Yes; ComponentLink1URL: https://datasheet.ciiva.com/11832/0900766b802749b3-11832506.pdf?src-supplier=RSComponents; ComponentLink1Description: https://datasheet.ciiva.com/11832/0900766b802749b3-11832506.pdf?src-supplier=RSComponents; ComponentLink2URL: https://datasheet.ciiva.com/8700/tc33-8700395.pdf?src-supplier=Avnet; ComponentLink2Description: https://datasheet.ciiva.com/8700/tc33-8700395.pdf?src-supplier=Avnet; ComponentLink3URL: https://datasheet.ciiva.com/2155/tc33-2155965.pdf?src-supplier=Digi-Key; ComponentLink3Description: https://datasheet.ciiva.com/2155/tc33-2155965.pdf?src-supplier=Digi-Key; ComponentLink4URL: https://datasheet.ciiva.com/7953/1818686-7953181.pdf?src-supplier=Element14; ComponentLink4Description: https://datasheet.ciiva.com/7953/1818686-7953181.pdf?src-supplier=Element14; ComponentLink5URL: https://datasheet.ciiva.com/16716/70155234-16716301.pdf?src-supplier=Allied+Electronics; ComponentLink5Description: https://datasheet.ciiva.com/16716/70155234-16716301.pdf?src-supplier=Allied+Electronics; ComponentLink6URL: https://datasheet.ciiva.com/2155/tc33-2155966.pdf?src-supplier=Digi-Key; ComponentLink6Description: https://datasheet.ciiva.com/2155/tc33-2155966.pdf?src-supplier=Digi-Key; ComponentLink7URL: https://datasheet.ciiva.com/7953/1818686-7953182.pdf?src-supplier=Element14; ComponentLink7Description: https://datasheet.ciiva.com/7953/1818686-7953182.pdf?src-supplier=Element14; ComponentLink8URL: https://datasheet.ciiva.com/2155/tc33-2155967.pdf?src-supplier=Digi-Key; ComponentLink8Description: https://datasheet.ciiva.com/2155/tc33-2155967.pdf?src-supplier=Digi-Key; Supplier Part Number 1: TC33X-2-104E; LCSC Part Number: C719186; Item Type: Trimmer
SW1-SW9 = DSIC05LS-P: Gull Wing SPST 24V 25mA Black -20℃~+70℃ 3000 Flat dial, raised type 2.54mm 5 SMD-10P,6x12.6mm DIP Switches ROHS; Manufacturer: XKB Connectivity; Item Type: Switch; Manufacturer Part Number: DSIC05LS-P; LCSC Part Number: C319036; ComponentLink1Description: LCSC; ComponentLink1URL: https://www.lcsc.com/product-detail/DIP-Switches_XKB-Connectivity-DSIC05LS-P_C319036.html
U3 = LM2904DT: General Purpose Amplifier 2 Circuit  8-SO; Manufacturer: STMicroelectronics; Number of Terminals/Pins: 8; Package Body Material: Plastic; Number of Channels: 2; Bandwidth: 1.1MHz; Max Supply Voltage: 30V; Min Supply Voltage: 3V; Min Dual Supply Voltage: 1.5V; Max Dual Supply Voltage: 15V; Voltage Gain: 100dB; Output Current: 40mA; Slew Rate: 0.6V/µs; Nominal Supply Current: 1.2mA; Common Mode Rejection Ratio: 70dB; Input Offset Voltage (Vos): 7mV; Input Bias Current: 150nA; Operating Supply Current: 700uA; Dual Supply Voltage: 9V; Max Supply Current: 32mA; Time @ Peak Reflow Temperature-Max (s): 40s; Item Type: IC; Supplier 1: Mouser; Manufacturer Part Number: LM2904DT; RoHS: Yes; Category: Amplifiers - Op Amps, Buffer, Instrumentation; Stock 1: 104539; Pricing 1: 1=0.44000, 10=0.34900, 50=0.34900, 100=0.25900, 1000=0.17000, 10000=0.15000 (USD); Mount: Surface Mount; Case/Package: SOIC; Number of Pins: 8; Contact Plating: Gold; Weight: 0.01lb; Package Shape: Rectangular; Terminal Finish: Nickel; Min Operating Temperature: -40°C; Max Operating Temperature: 125°C; Packaging: Tape and Reel; Gain Bandwidth Product: 1.1MHz; Number of Circuits: 2; Package Quantity: 2500; Operating Supply Voltage: 15V; Supply Current: 1.2mA; Technology: BIPOLAR; Series: -; Output Current per Channel: 40mA; Number of Elements: 2; Number of Amplifiers: 2; Amplifier Type: GENERAL PURPOSE; Unity Gain Bandwidth Product: 1.1MHz; Number of Functions: 2; Terminal Form: Gull Wing; Terminal Position: DUAL; Moisture Sensitivity Level: 1; JESD-30 Code: R-PDSO-G8; Surface Mount: Yes; Peak Reflow Temperature (Cel): 260°C; Input Offset Voltage-Max: 7mV; Slew Rate-Nom: 0.6V/µs; Length: 4.9mm; Width: 3.9mm; Height: 1.25mm; Radiation Hardening: No; Reach SVHC Compliant: Yes; Lead Free: Contains Lead; RoHS Compliant: Yes; Temperature Grade: AUTOMOTIVE; ComponentLink1URL: https://datasheet.ciiva.com/5703/1802155-5703335.pdf?src-supplier=Farnell; ComponentLink1Description: https://datasheet.ciiva.com/5703/1802155-5703335.pdf?src-supplier=Farnell; ComponentLink2URL: https://datasheet.ciiva.com/27055/1993227-27055857.pdf?src-supplier=Jameco; ComponentLink2Description: https://datasheet.ciiva.com/27055/1993227-27055857.pdf?src-supplier=Jameco; ComponentLink3URL: https://datasheet.ciiva.com/15129/getdatasheetpartid-32489-15129656.pdf?src-supplier=Verical; ComponentLink3Description: https://datasheet.ciiva.com/15129/getdatasheetpartid-32489-15129656.pdf?src-supplier=Verical; ComponentLink4URL: https://datasheet.ciiva.com/41459/001185000-da-01-en-ic-op-amp-low-pwr-du-lm2904dt-soic-8-stm-41459659.pdf?src-supplier=Conrad; ComponentLink4Description: https://datasheet.ciiva.com/41459/001185000-da-01-en-ic-op-amp-low-pwr-du-lm2904dt-soic-8-stm-41459659.pdf?src-supplier=Conrad; ComponentLink5URL: https://datasheet.ciiva.com/1795/cd00000535-1795476.pdf?src-supplier=Digi-Key; ComponentLink5Description: https://datasheet.ciiva.com/1795/cd00000535-1795476.pdf?src-supplier=Digi-Key; ComponentLink6URL: https://datasheet.ciiva.com/1795/cd00000535-1795475.pdf?src-supplier=Digi-Key; ComponentLink6Description: https://datasheet.ciiva.com/1795/cd00000535-1795475.pdf?src-supplier=Digi-Key; ComponentLink7URL: https://datasheet.ciiva.com/1795/cd00000535-1795477.pdf?src-supplier=Digi-Key; ComponentLink7Description: https://datasheet.ciiva.com/1795/cd00000535-1795477.pdf?src-supplier=Digi-Key; ComponentLink8URL: https://datasheet.ciiva.com/16200/cd00000535-16200605.pdf?src-supplier=Future+Electronics; ComponentLink8Description: https://datasheet.ciiva.com/16200/cd00000535-16200605.pdf?src-supplier=Future+Electronics; Supplier Part Number 1: 511-LM2904DT; LCSC Part Number: C105411